# Altium schematic sheet Main.SchDoc
size A3; SheetNumber: 1; SheetTotal: 8
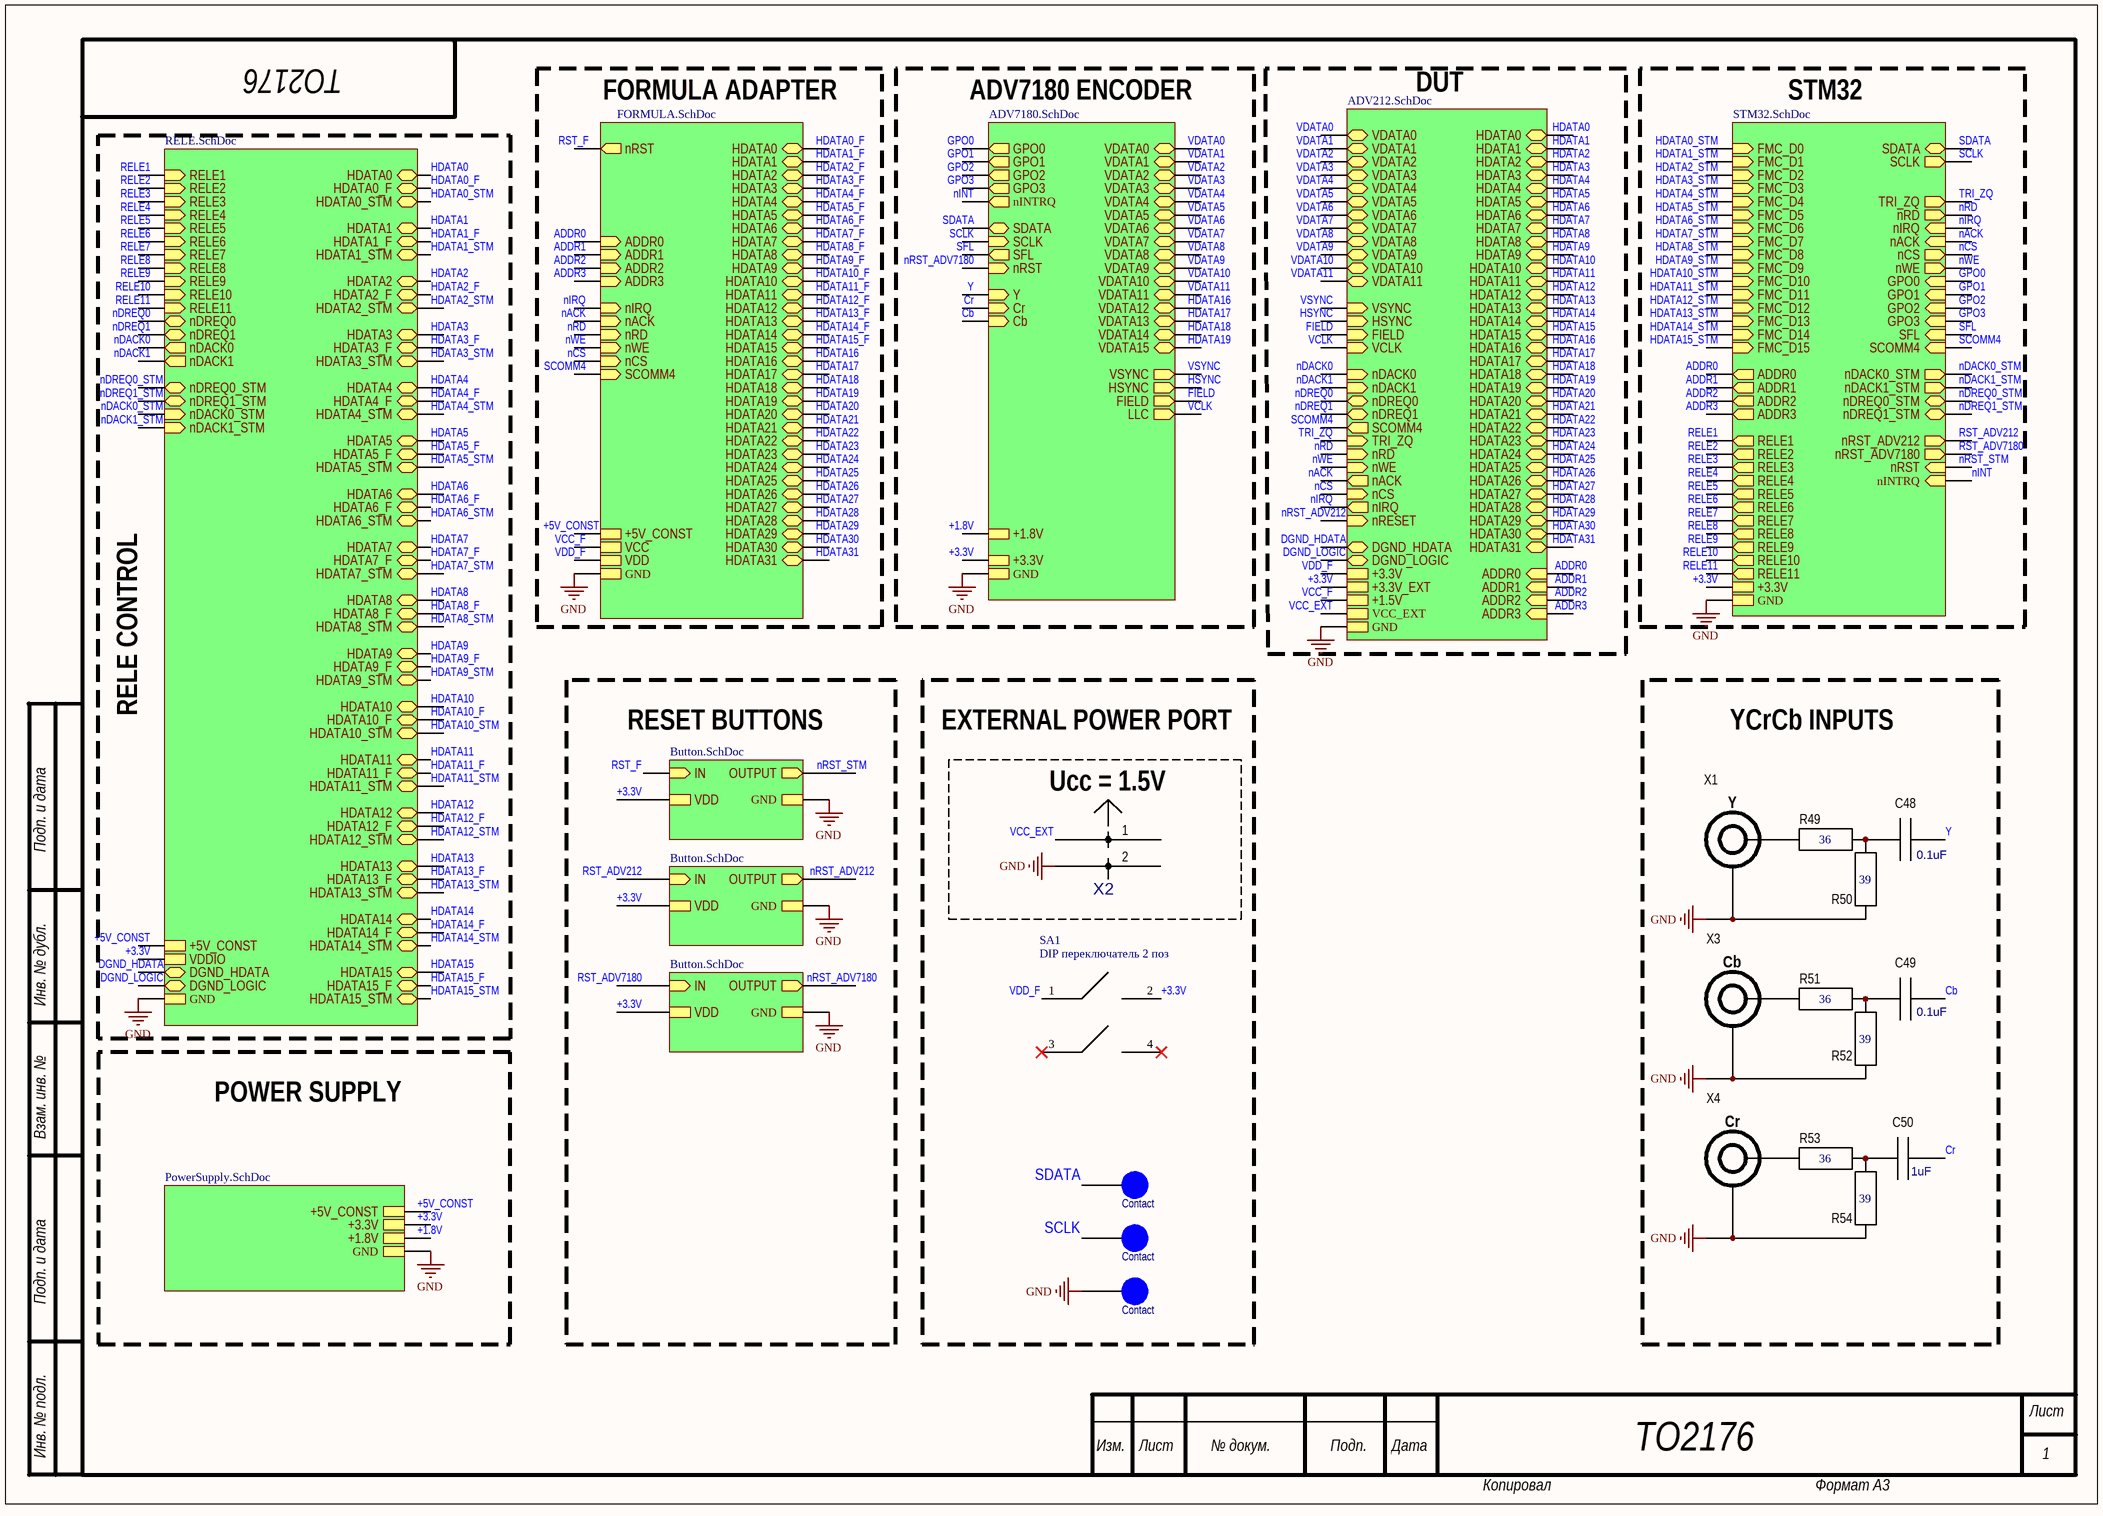
[diagram p0: Main.SchDoc]

## Parts
C48  0.1uF  [0603]
C49  0.1uF  [0603]
C50  1uF  [0603]
KP1  Contact  [Contact]
KP2  Contact  [Contact]
KP3  Contact  [Contact]
R49  36  [0603]
R50  39  [0603]
R51  36  [0603]
R52  39  [0603]
R53  36  [0603]
R54  39  [0603]
SA1  DIP переключатель 2 поз  [DMHA-02G]
X1  Коннектор "Тюльпан"  [NYS-354]  (value not drawn)
X2  DS1073-01-2x1-MRT6 (2pin)  [DS1073-01-2x1-MRT6 (2 pin)]  (value not drawn)
X3  Коннектор "Тюльпан"  [NYS-354]  (value not drawn)
X4  Коннектор "Тюльпан"  [NYS-354]  (value not drawn)

## Blocks framed on the sheet
EXTERNAL POWER PORT: KP1-KP3 SA1
YCrCb INPUTS: C48-C50 R49-R54 X1 X3 X4
Ucc = 1.5V: X2

## Sub-sheets
ADV212 = ADV212.SchDoc: HDATA7 (bidir), HDATA8 (bidir), HDATA6 (bidir), HDATA5 (bidir), HDATA11 (bidir), HDATA10 (bidir), HDATA3 (bidir), HDATA4 (bidir), HDATA9 (bidir), HDATA12 (bidir), HDATA13 (bidir), HDATA14 (bidir), HDATA15 (bidir), HDATA2 (bidir), HDATA1 (bidir), HDATA0 (bidir), VDATA9 (bidir), VDATA10 (bidir), VDATA8 (bidir), VDATA7 (bidir), VDATA5 (bidir), VDATA6 (bidir), VDATA11 (bidir), VDATA4 (bidir), VDATA3 (bidir), VDATA2 (bidir), ADDR1 (in), ADDR2 (in), ADDR0 (in), ADDR3 (in), nRD (in), nWE (in), nACK (out), nCS (in), nIRQ (out), nDREQ1 (bidir), nDACK0 (in), nDACK1 (in), nDREQ0 (bidir), +3.3V_EXT, +1.5V, TRI_ZQ (in), FIELD (in), VSYNC (in), HSYNC (in), +3.3V, VCLK (in), nRESET (in), SCOMM4 (out), HDATA19 (bidir), HDATA18 (bidir), HDATA17 (bidir), HDATA16 (bidir), VDATA0 (bidir), VDATA1 (bidir), DGND_LOGIC (bidir), DGND_HDATA (bidir), HDATA27 (bidir), HDATA24 (bidir), HDATA28 (bidir), HDATA20 (bidir), HDATA26 (bidir), HDATA22 (bidir), HDATA31 (bidir), HDATA25 (bidir), HDATA29 (bidir), HDATA23 (bidir), HDATA21 (bidir), HDATA30 (bidir), GND, VCC_EXT
ADV7180 = ADV7180.SchDoc: +1.8V, GPO3 (out), VSYNC (out), VDATA5 (bidir), SDATA (bidir), SFL (out), VDATA0 (bidir), VDATA8 (bidir), VDATA13 (bidir), VDATA12 (bidir), GPO2 (out), +3.3V, VDATA4 (bidir), VDATA9 (bidir), VDATA2 (bidir), GPO1 (out), FIELD (out), LLC (out), VDATA10 (bidir), GPO0 (out), VDATA6 (bidir), SCLK (in), VDATA7 (bidir), HSYNC (out), VDATA3 (bidir), VDATA11 (bidir), VDATA14 (bidir), VDATA1 (bidir), VDATA15 (bidir), Cr (in), Cb (in), Y (in), nRST (in), GND, nINTRQ (out)
BTN1 = Button.SchDoc: VDD, IN (in), OUTPUT (out), GND
BTN2 = Button.SchDoc: VDD, IN (in), OUTPUT (out), GND
BTN2 = Button.SchDoc: VDD, IN (in), OUTPUT (out), GND
F2K = FORMULA.SchDoc: HDATA13 (bidir), HDATA12 (bidir), HDATA9 (bidir), HDATA6 (bidir), HDATA10 (bidir), HDATA4 (bidir), HDATA3 (bidir), HDATA8 (bidir), HDATA11 (bidir), HDATA2 (bidir), HDATA14 (bidir), HDATA15 (bidir), HDATA1 (bidir), HDATA7 (bidir), HDATA0 (bidir), HDATA5 (bidir), nRST (out), VDD, VCC, ADDR0 (in), ADDR3 (in), SCOMM4 (in), nCS (in), nIRQ (in), nACK (in), ADDR2 (in), ADDR1 (in), nRD (in), nWE (in), HDATA22 (bidir), HDATA29 (bidir), HDATA24 (bidir), HDATA28 (bidir), HDATA26 (bidir), HDATA16 (bidir), HDATA18 (bidir), HDATA21 (bidir), HDATA30 (bidir), HDATA31 (bidir), HDATA17 (bidir), HDATA23 (bidir), HDATA27 (bidir), HDATA19 (bidir), HDATA25 (bidir), HDATA20 (bidir), +5V_CONST, GND
PS = PowerSupply.SchDoc: +1.8V, +5V_CONST, +3.3V, GND
REL = RELE.SchDoc: RELE9 (in), RELE10 (in), RELE4 (in), RELE7 (in), RELE3 (in), RELE1 (in), RELE6 (in), RELE5 (in), RELE8 (in), RELE2 (in), +5V_CONST, VDDIO, HDATA15 (bidir), HDATA5 (bidir), HDATA5_STM (bidir), HDATA4 (bidir), nDACK0 (out), HDATA12 (bidir), HDATA2_STM (bidir), HDATA2 (bidir), HDATA8_STM (bidir), HDATA7 (bidir), nDACK1 (out), HDATA7_STM (bidir), HDATA8 (bidir), HDATA3 (bidir), HDATA4_STM (bidir), nDREQ0 (bidir), HDATA10 (bidir), HDATA0_STM (bidir), HDATA14 (bidir), HDATA1_STM (bidir), HDATA9 (bidir), HDATA11 (bidir), HDATA13 (bidir), HDATA0 (bidir), HDATA6_STM (bidir), nDREQ1 (bidir), HDATA9_STM (bidir), HDATA6 (bidir), HDATA3_STM (bidir), HDATA1 (bidir), HDATA14_F (bidir), HDATA14_STM (bidir), HDATA10_F (bidir), HDATA8_F (bidir), HDATA15_STM (bidir), HDATA9_F (bidir), HDATA3_F (bidir), nDREQ0_STM (bidir), HDATA7_F (bidir), HDATA11_F (bidir), HDATA4_F (bidir), HDATA6_F (bidir), HDATA10_STM (bidir), HDATA5_F (bidir), HDATA13_F (bidir), HDATA11_STM (bidir), nDACK1_STM (in), nDREQ1_STM (bidir), HDATA13_STM (bidir), HDATA15_F (bidir), HDATA2_F (bidir), HDATA1_F (bidir), HDATA12_F (bidir), HDATA0_F (bidir), HDATA12_STM (bidir), nDACK0_STM (in), RELE11 (in), DGND_HDATA (bidir), DGND_LOGIC (bidir), GND
STM32 = STM32.SchDoc: FMC_D9 (in), FMC_D13 (in), FMC_D11 (in), FMC_D2 (in), FMC_D15 (in), FMC_D1 (in), FMC_D0 (in), FMC_D7 (in), FMC_D8 (in), FMC_D5 (in), FMC_D12 (in), FMC_D4 (in), FMC_D6 (in), FMC_D3 (in), FMC_D10 (in), FMC_D14 (in), ADDR2 (out), ADDR0 (out), ADDR3 (out), ADDR1 (out), nDACK0_STM (out), nDREQ1_STM (bidir), nDACK1_STM (out), nDREQ0_STM (bidir), +3.3V, SDATA (bidir), SCLK (out), TRI_ZQ (out), nRD (out), nIRQ (in), nACK (in), nCS (out), nWE (out), GPO1 (in), GPO2 (in), GPO0 (in), SFL (in), GPO3 (in), nRST (in), RELE8 (out), RELE6 (out), RELE7 (out), RELE9 (out), RELE1 (out), RELE2 (out), RELE10 (out), RELE4 (out), RELE3 (out), RELE5 (out), RELE11 (out), nRST_ADV212 (out), nRST_ADV7180 (out), SCOMM4 (in), GND, nINTRQ (in)

## Nets
GND: KP3.1 R50.1 R52.2 R54.2 X1.2 X2.2 X3.2 X4.2 ; sheet ADV212/GND, sheet STM32/GND, sheet F2K/GND, sheet ADV7180/GND, sheet REL/GND, sheet PS/GND, sheet BTN1/GND, sheet BTN2/GND, sheet BTN2/GND
+1.8V: sheet ADV7180/+1.8V, sheet PS/+1.8V
+3.3V: SA1.2 ; sheet ADV212/+3.3V_EXT, sheet STM32/+3.3V, sheet ADV7180/+3.3V, sheet REL/VDDIO, sheet PS/+3.3V, sheet BTN1/VDD, sheet BTN2/VDD, sheet BTN2/VDD
+5V_CONST: sheet F2K/+5V_CONST, sheet REL/+5V_CONST, sheet PS/+5V_CONST
ADDR0: sheet ADV212/ADDR0, sheet STM32/ADDR0, sheet F2K/ADDR0
ADDR1: sheet ADV212/ADDR1, sheet STM32/ADDR1, sheet F2K/ADDR1
ADDR2: sheet ADV212/ADDR2, sheet STM32/ADDR2, sheet F2K/ADDR2
ADDR3: sheet ADV212/ADDR3, sheet STM32/ADDR3, sheet F2K/ADDR3
Cb: C49.1 ; sheet ADV7180/Cb
Cr: C50.1 ; sheet ADV7180/Cr
DGND_HDATA: sheet ADV212/DGND_HDATA, sheet REL/DGND_HDATA
DGND_LOGIC: sheet ADV212/DGND_LOGIC, sheet REL/DGND_LOGIC
FIELD: sheet ADV212/FIELD, sheet ADV7180/FIELD
GPO0: sheet STM32/GPO0, sheet ADV7180/GPO0
GPO1: sheet STM32/GPO1, sheet ADV7180/GPO1
GPO2: sheet STM32/GPO2, sheet ADV7180/GPO2
GPO3: sheet STM32/GPO3, sheet ADV7180/GPO3
HDATA0: sheet ADV212/HDATA0, sheet REL/HDATA0
HDATA0_F: sheet F2K/HDATA0, sheet REL/HDATA0_F
HDATA0_STM: sheet STM32/FMC_D0, sheet REL/HDATA0_STM
HDATA1: sheet ADV212/HDATA1, sheet REL/HDATA1
HDATA1_F: sheet F2K/HDATA1, sheet REL/HDATA1_F
HDATA1_STM: sheet STM32/FMC_D1, sheet REL/HDATA1_STM
HDATA2: sheet ADV212/HDATA2, sheet REL/HDATA2
HDATA2_F: sheet F2K/HDATA2, sheet REL/HDATA2_F
HDATA2_STM: sheet STM32/FMC_D2, sheet REL/HDATA2_STM
HDATA3: sheet ADV212/HDATA3, sheet REL/HDATA3
HDATA3_F: sheet F2K/HDATA3, sheet REL/HDATA3_F
HDATA3_STM: sheet STM32/FMC_D3, sheet REL/HDATA3_STM
HDATA4: sheet ADV212/HDATA4, sheet REL/HDATA4
HDATA4_F: sheet F2K/HDATA4, sheet REL/HDATA4_F
HDATA4_STM: sheet STM32/FMC_D4, sheet REL/HDATA4_STM
HDATA5: sheet ADV212/HDATA5, sheet REL/HDATA5
HDATA5_F: sheet F2K/HDATA5, sheet REL/HDATA5_F
HDATA5_STM: sheet STM32/FMC_D5, sheet REL/HDATA5_STM
HDATA6: sheet ADV212/HDATA6, sheet REL/HDATA6
HDATA6_F: sheet F2K/HDATA6, sheet REL/HDATA6_F
HDATA6_STM: sheet STM32/FMC_D6, sheet REL/HDATA6_STM
HDATA7: sheet ADV212/HDATA7, sheet REL/HDATA7
HDATA7_F: sheet F2K/HDATA7, sheet REL/HDATA7_F
HDATA7_STM: sheet STM32/FMC_D7, sheet REL/HDATA7_STM
HDATA8: sheet ADV212/HDATA8, sheet REL/HDATA8
HDATA8_F: sheet F2K/HDATA8, sheet REL/HDATA8_F
HDATA8_STM: sheet STM32/FMC_D8, sheet REL/HDATA8_STM
HDATA9: sheet ADV212/HDATA9, sheet REL/HDATA9
HDATA9_F: sheet F2K/HDATA9, sheet REL/HDATA9_F
HDATA9_STM: sheet STM32/FMC_D9, sheet REL/HDATA9_STM
HDATA10: sheet ADV212/HDATA10, sheet REL/HDATA10
HDATA10_F: sheet F2K/HDATA10, sheet REL/HDATA10_F
HDATA10_STM: sheet STM32/FMC_D10, sheet REL/HDATA10_STM
HDATA11: sheet ADV212/HDATA11, sheet REL/HDATA11
HDATA11_F: sheet F2K/HDATA11, sheet REL/HDATA11_F
HDATA11_STM: sheet STM32/FMC_D11, sheet REL/HDATA11_STM
HDATA12: sheet ADV212/HDATA12, sheet REL/HDATA12
HDATA12_F: sheet F2K/HDATA12, sheet REL/HDATA12_F
HDATA12_STM: sheet STM32/FMC_D12, sheet REL/HDATA12_STM
HDATA13: sheet ADV212/HDATA13, sheet REL/HDATA13
HDATA13_F: sheet F2K/HDATA13, sheet REL/HDATA13_F
HDATA13_STM: sheet STM32/FMC_D13, sheet REL/HDATA13_STM
HDATA14: sheet ADV212/HDATA14, sheet REL/HDATA14
HDATA14_F: sheet F2K/HDATA14, sheet REL/HDATA14_F
HDATA14_STM: sheet STM32/FMC_D14, sheet REL/HDATA14_STM
HDATA15: sheet ADV212/HDATA15, sheet REL/HDATA15
HDATA15_F: sheet F2K/HDATA15, sheet REL/HDATA15_F
HDATA15_STM: sheet STM32/FMC_D15, sheet REL/HDATA15_STM
HDATA16: sheet ADV212/HDATA16, sheet F2K/HDATA16, sheet ADV7180/VDATA12
HDATA17: sheet ADV212/HDATA17, sheet F2K/HDATA17, sheet ADV7180/VDATA13
HDATA18: sheet ADV212/HDATA18, sheet F2K/HDATA18, sheet ADV7180/VDATA14
HDATA19: sheet ADV212/HDATA19, sheet F2K/HDATA19, sheet ADV7180/VDATA15
HDATA20: sheet ADV212/HDATA20, sheet F2K/HDATA20
HDATA21: sheet ADV212/HDATA21, sheet F2K/HDATA21
HDATA22: sheet ADV212/HDATA22, sheet F2K/HDATA22
HDATA23: sheet ADV212/HDATA23, sheet F2K/HDATA23
HDATA24: sheet ADV212/HDATA24, sheet F2K/HDATA24
HDATA25: sheet ADV212/HDATA25, sheet F2K/HDATA25
HDATA26: sheet ADV212/HDATA26, sheet F2K/HDATA26
HDATA27: sheet ADV212/HDATA27, sheet F2K/HDATA27
HDATA28: sheet ADV212/HDATA28, sheet F2K/HDATA28
HDATA29: sheet ADV212/HDATA29, sheet F2K/HDATA29
HDATA30: sheet ADV212/HDATA30, sheet F2K/HDATA30
HDATA31: sheet ADV212/HDATA31, sheet F2K/HDATA31
HSYNC: sheet ADV212/HSYNC, sheet ADV7180/HSYNC
nACK: sheet ADV212/nACK, sheet STM32/nACK, sheet F2K/nACK
nCS: sheet ADV212/nCS, sheet STM32/nCS, sheet F2K/nCS
nDACK0: sheet ADV212/nDACK0, sheet REL/nDACK0
nDACK0_STM: sheet STM32/nDACK0_STM, sheet REL/nDACK0_STM
nDACK1: sheet ADV212/nDACK1, sheet REL/nDACK1
nDACK1_STM: sheet STM32/nDACK1_STM, sheet REL/nDACK1_STM
nDREQ0: sheet ADV212/nDREQ0, sheet REL/nDREQ0
nDREQ0_STM: sheet STM32/nDREQ0_STM, sheet REL/nDREQ0_STM
nDREQ1: sheet ADV212/nDREQ1, sheet REL/nDREQ1
nDREQ1_STM: sheet STM32/nDREQ1_STM, sheet REL/nDREQ1_STM
nINT: sheet STM32/nINTRQ, sheet ADV7180/nINTRQ
nIRQ: sheet ADV212/nIRQ, sheet STM32/nIRQ, sheet F2K/nIRQ
nRD: sheet ADV212/nRD, sheet STM32/nRD, sheet F2K/nRD
nRST_ADV212: sheet ADV212/nRESET, sheet BTN2/OUTPUT
nRST_ADV7180: sheet ADV7180/nRST, sheet BTN2/OUTPUT
nRST_STM: sheet STM32/nRST, sheet BTN1/OUTPUT
nWE: sheet ADV212/nWE, sheet STM32/nWE, sheet F2K/nWE
RELE1: sheet STM32/RELE1, sheet REL/RELE1
RELE2: sheet STM32/RELE2, sheet REL/RELE2
RELE3: sheet STM32/RELE3, sheet REL/RELE3
RELE4: sheet STM32/RELE4, sheet REL/RELE4
RELE5: sheet STM32/RELE5, sheet REL/RELE5
RELE6: sheet STM32/RELE6, sheet REL/RELE6
RELE7: sheet STM32/RELE7, sheet REL/RELE7
RELE8: sheet STM32/RELE8, sheet REL/RELE8
RELE9: sheet STM32/RELE9, sheet REL/RELE9
RELE10: sheet STM32/RELE10, sheet REL/RELE10
RELE11: sheet STM32/RELE11, sheet REL/RELE11
RST_ADV212: sheet STM32/nRST_ADV212, sheet BTN2/IN
RST_ADV7180: sheet STM32/nRST_ADV7180, sheet BTN2/IN
RST_F: sheet F2K/nRST, sheet BTN1/IN
SCLK: KP2.1 ; sheet STM32/SCLK, sheet ADV7180/SCLK
SCOMM4: sheet ADV212/SCOMM4, sheet STM32/SCOMM4, sheet F2K/SCOMM4
SDATA: KP1.1 ; sheet STM32/SDATA, sheet ADV7180/SDATA
SFL: sheet STM32/SFL, sheet ADV7180/SFL
TRI_ZQ: sheet ADV212/TRI_ZQ, sheet STM32/TRI_ZQ
VCC_EXT: X2.1 ; sheet ADV212/VCC_EXT
VCC_F: sheet ADV212/+1.5V, sheet F2K/VCC
VCLK: sheet ADV212/VCLK, sheet ADV7180/LLC
VDATA0: sheet ADV212/VDATA0, sheet ADV7180/VDATA0
VDATA1: sheet ADV212/VDATA1, sheet ADV7180/VDATA1
VDATA2: sheet ADV212/VDATA2, sheet ADV7180/VDATA2
VDATA3: sheet ADV212/VDATA3, sheet ADV7180/VDATA3
VDATA4: sheet ADV212/VDATA4, sheet ADV7180/VDATA4
VDATA5: sheet ADV212/VDATA5, sheet ADV7180/VDATA5
VDATA6: sheet ADV212/VDATA6, sheet ADV7180/VDATA6
VDATA7: sheet ADV212/VDATA7, sheet ADV7180/VDATA7
VDATA8: sheet ADV212/VDATA8, sheet ADV7180/VDATA8
VDATA9: sheet ADV212/VDATA9, sheet ADV7180/VDATA9
VDATA10: sheet ADV212/VDATA10, sheet ADV7180/VDATA10
VDATA11: sheet ADV212/VDATA11, sheet ADV7180/VDATA11
VDD_F: SA1.1 ; sheet ADV212/+3.3V, sheet F2K/VDD
VSYNC: sheet ADV212/VSYNC, sheet ADV7180/VSYNC
Y: C48.1 ; sheet ADV7180/Y
NetC48_2: C48.2 R49.2 R50.2
NetC49_2: C49.2 R51.2 R52.1
NetC50_2: C50.2 R53.2 R54.1
NetR49_1: R49.1 X1.1
NetR51_1: R51.1 X3.1
NetR53_1: R53.1 X4.1

Not connected (* = marked no-connect by the designer): SA1 3* 4*

## Notes on the sheet
- ТО2176
- FORMULA ADAPTER
- ADV7180 ENCODER
- DUT
- STM32
- RELE CONTROL
- RESET BUTTONS
- Подп. и дата
- (near X1) Y
- (near X3) Cb
- Инв. № дубл.
- POWER SUPPLY
- (near X4) Cr
- Взам. инв. №
- Инв. № подл.
- Изм.
- Лист
- № докум.
- Подп.
- Дата
- 1
- Копировал
- Формат А3

## Library data of the parts
C48-C50 = C0603: ComponentHeigt: 1.3; Firme: AVX; Leadform: SMD; KIND: Конденсатор; ClassName: *; Component Link: *; ComponentWeigt: *; Packaging: 0805; NN: *; Value: *
R49-R54 = R0603 Yageo: ComponentHeigt: 0.5; Leadform: SMD; Firme: Yageo; Kind: Резистор; Packaging: 0402; ClassName: *; Component Link: *; NN: *
SA1 = DMHA-02G-G
X1 = NYS-354: Y
X2 = DS1073-01-2x1-MRT6 (2pin): ComponentHeigt: 5.5; Name: Вилка; Specification: Вилка PLD2-2 *; Typ: PLD2-2; ClassName: *; Component Link: *; ComponentWeigt: *; Firme: *; Leadform: *; NN: *; KIND: *
X3 = NYS-354: Cb
X4 = NYS-354: Cr